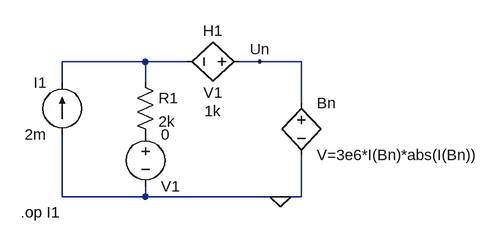
[diagram p0: schematic DC_nieliniowy.asc]
DC_nieliniowy.asc, the LTspice schematic file:
Version 4
SHEET 1 880 680
WIRE 208 80 80 80
WIRE 272 80 208 80
WIRE 384 80 352 80
WIRE 448 80 384 80
WIRE 80 112 80 80
WIRE 208 112 208 80
WIRE 448 144 448 80
WIRE 80 288 80 192
WIRE 208 288 208 272
WIRE 208 288 80 288
WIRE 416 288 208 288
WIRE 448 288 448 224
WIRE 448 288 416 288
FLAG 384 80 Un
FLAG 416 288 0
SYMBOL current 80 192 R180
WINDOW 0 24 80 Left 2
WINDOW 3 24 0 Left 2
WINDOW 123 0 0 Left 0
WINDOW 39 0 0 Left 0
SYMATTR InstName I1
SYMATTR Value 2m
SYMBOL res 192 96 R0
SYMATTR InstName R1
SYMATTR Value 2k
SYMBOL h 368 80 R90
WINDOW 0 -32 56 VBottom 2
WINDOW 3 32 56 VTop 2
WINDOW 123 60 56 VTop 2
SYMATTR InstName H1
SYMATTR Value V1
SYMATTR Value2 1k
SYMBOL voltage 208 176 R0
WINDOW 0 24 96 Left 2
WINDOW 3 24 16 Left 2
WINDOW 123 0 0 Left 0
WINDOW 39 0 0 Left 0
SYMATTR InstName V1
SYMATTR Value 0
SYMBOL bv 448 128 R0
SYMATTR InstName Bn
SYMATTR Value V=3e6*I(Bn)*abs(I(Bn))
TEXT 16 312 Left 2 !.op I1

The netlist it stands for:
* DC_nieliniowy.asc
I1 0 N001 2m
R1 N001 P001 2k
H1 Un N001 V1 1k
V1 P001 0 0
Bn Un 0 V=3e6*I(Bn)*abs(I(Bn))
.op I1
.backanno
.end